# Altium schematic sheet 00.Izdelie.Title.SchDoc
size 209 x 297 mm; Author: Мурашкин Д.В.; Address1: Address1; Address2: Address2; Address3: Address3; Address4: Address4; DocumentNumber: ИЗДЕЛИЕ-1-2; SheetNumber: 1; SheetTotal: 27; Scale: 1:1; Letter1Column: Э; PartName: Кабели
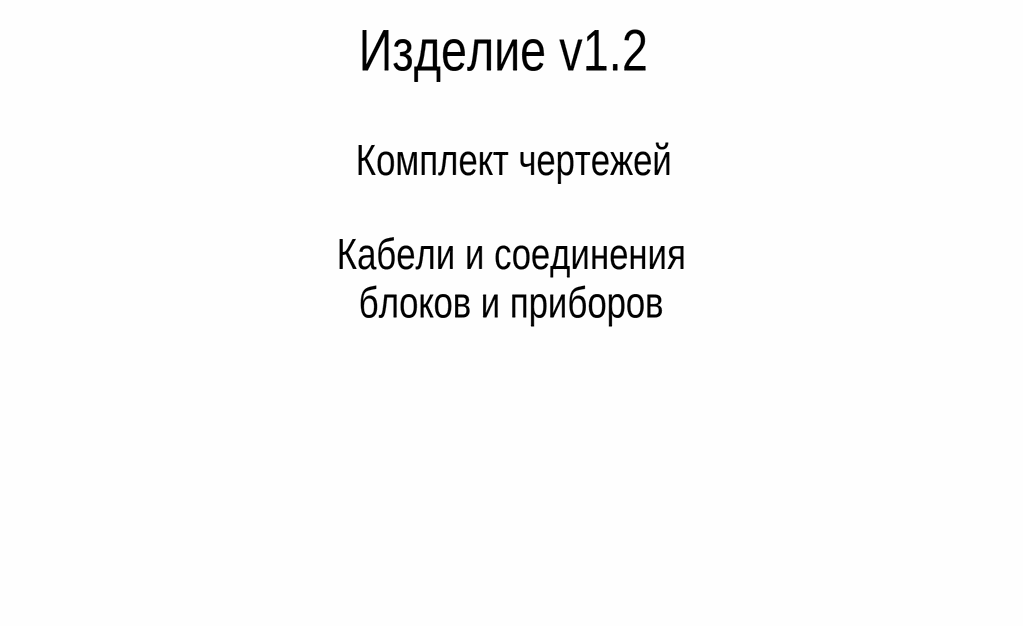
[diagram p0: 00.Izdelie.Title.SchDoc]

## Notes on the sheet
- Изделие v1.2
- Комплект чертежей
- Кабели и соединения
  блоков и приборов
- Перв. примен.
- Справ. №
- Подп. и дата
- Инв. № дубл.
- Взам. инв. №
- Разраб.
- Изм.
- Лист
- № докум.
- Подп.
- Дата
- Лит.
- Масса
- Масштаб
- Пров.
- Т.контр.
- Листов
- Инв. № подл.
- Утв.
- Н.контр.
- 2.106-A4
- Копировал
- Формат А4